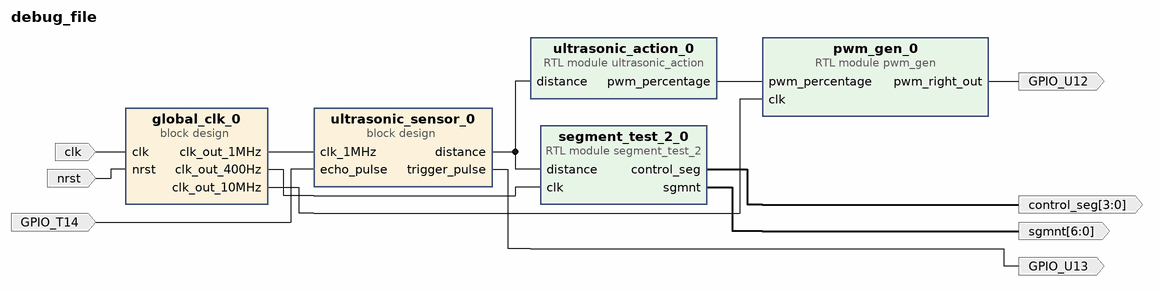
[diagram p0: block diagram of the top level]
# Vivado block design debug_file, xc7z020clg400-1, Vivado 2023.1
create_bd_design debug_file

create_bd_port -dir I clk
create_bd_port -dir I nrst
create_bd_port -dir O -from 6 -to 0 sgmnt
create_bd_port -dir O -from 3 -to 0 control_seg
create_bd_port -dir O GPIO_U13
create_bd_port -dir I GPIO_T14
create_bd_port -dir O GPIO_U12

create_bd_cell -type container -reference global_clk global_clk_0
set_property -dict [list \
  CONFIG.ACTIVE_SIM_BD global_clk.bd \
  CONFIG.ACTIVE_SYNTH_BD global_clk.bd \
  CONFIG.ENABLE_DFX 0 \
  CONFIG.LIST_SIM_BD global_clk.bd \
  CONFIG.LIST_SYNTH_BD global_clk.bd \
  CONFIG.LOCK_PROPAGATE 0 \
] [get_bd_cells global_clk_0]
create_bd_cell -type module -reference segment_test_2 segment_test_2_0
create_bd_cell -type container -reference ultrasonic_sensor ultrasonic_sensor_0
set_property -dict [list \
  CONFIG.ACTIVE_SIM_BD ultrasonic_sensor.bd \
  CONFIG.ACTIVE_SYNTH_BD ultrasonic_sensor.bd \
  CONFIG.ENABLE_DFX 0 \
  CONFIG.LIST_SIM_BD ultrasonic_sensor.bd \
  CONFIG.LIST_SYNTH_BD ultrasonic_sensor.bd \
  CONFIG.LOCK_PROPAGATE 0 \
] [get_bd_cells ultrasonic_sensor_0]
create_bd_cell -type module -reference pwm_gen pwm_gen_0
create_bd_cell -type module -reference ultrasonic_action ultrasonic_action_0

# ---- connections ----

connect_bd_net -net GPIO_T14_1 [get_bd_ports GPIO_T14] [get_bd_pins ultrasonic_sensor_0/echo_pulse]
connect_bd_net [get_bd_ports clk] [get_bd_pins global_clk_0/clk]
connect_bd_net [get_bd_pins global_clk_0/clk_out_10MHz] [get_bd_pins pwm_gen_0/clk]
connect_bd_net [get_bd_pins global_clk_0/clk_out_1MHz] [get_bd_pins ultrasonic_sensor_0/clk_1MHz]
connect_bd_net [get_bd_pins global_clk_0/clk_out_400Hz] [get_bd_pins segment_test_2_0/clk]
connect_bd_net [get_bd_ports nrst] [get_bd_pins global_clk_0/nrst]
connect_bd_net [get_bd_pins pwm_gen_0/pwm_right_out] [get_bd_ports GPIO_U12]
connect_bd_net [get_bd_pins segment_test_2_0/control_seg] [get_bd_ports control_seg]
connect_bd_net [get_bd_pins segment_test_2_0/sgmnt] [get_bd_ports sgmnt]
connect_bd_net [get_bd_pins ultrasonic_action_0/pwm_percentage] [get_bd_pins pwm_gen_0/pwm_percentage]
connect_bd_net [get_bd_pins ultrasonic_sensor_0/distance] [get_bd_pins segment_test_2_0/distance] [get_bd_pins ultrasonic_action_0/distance]
connect_bd_net [get_bd_pins ultrasonic_sensor_0/trigger_pulse] [get_bd_ports GPIO_U13]

validate_bd_design
save_bd_design
